# Altium schematic sheet MCU_Module.SchDoc
size A4; SheetNumber: 5; SheetTotal: 7
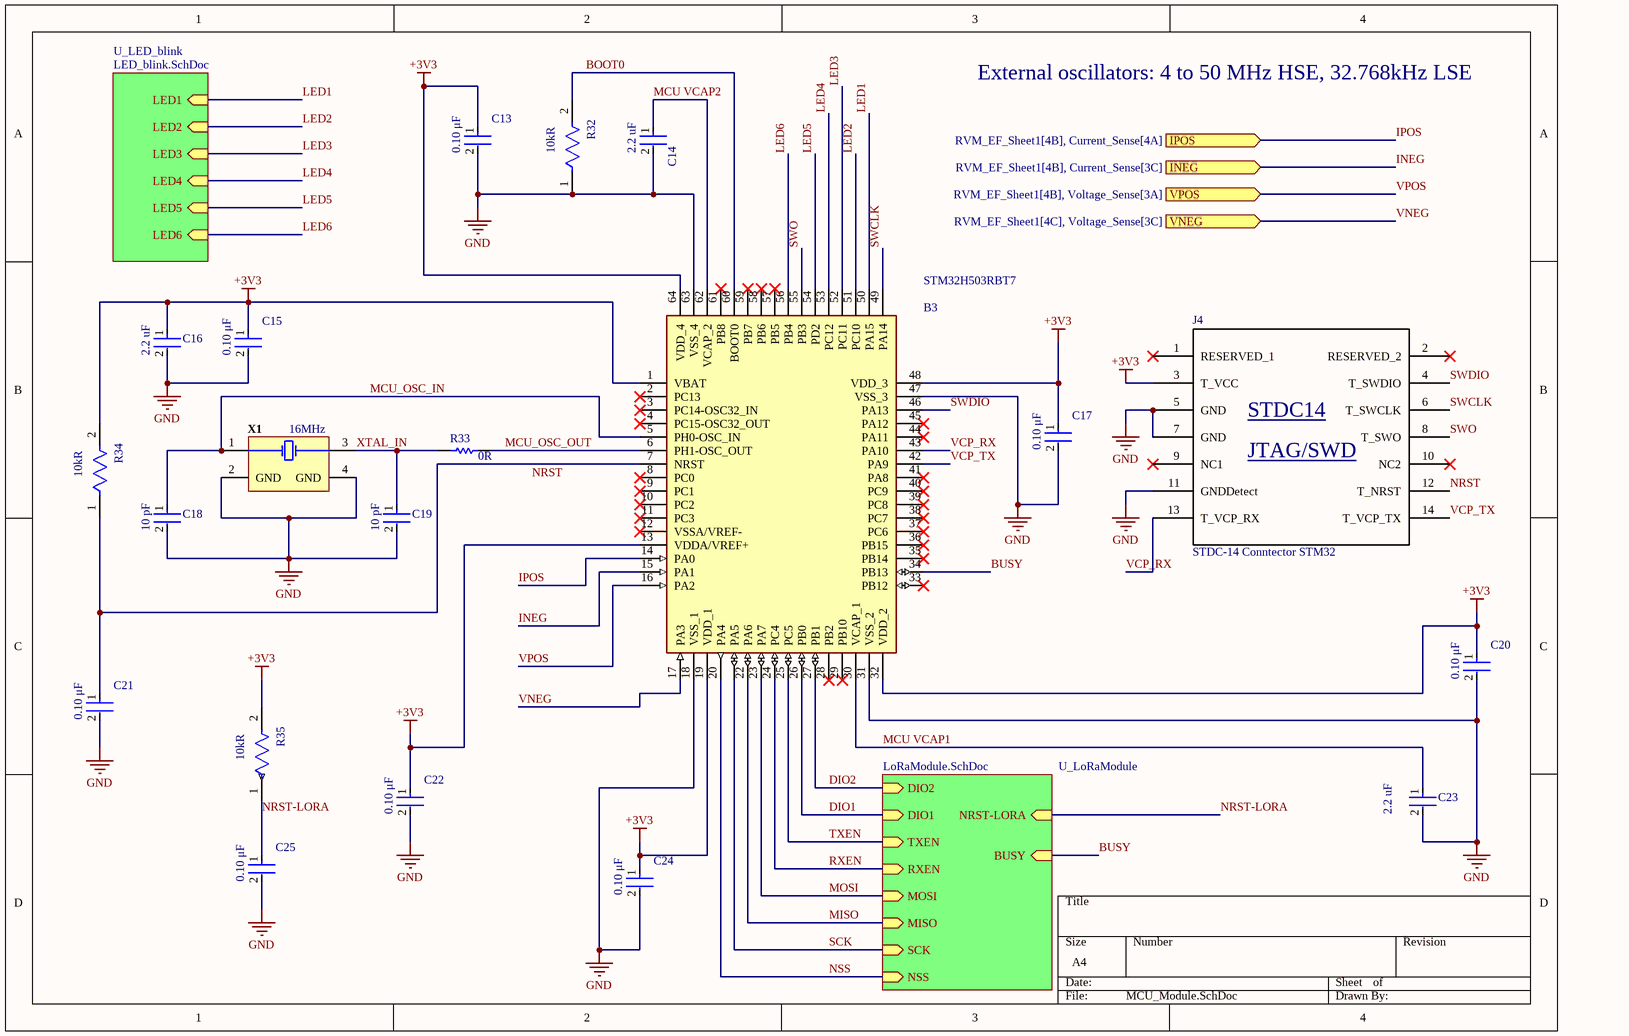
[diagram p0: MCU_Module.SchDoc]

## Parts
B3  STM32H503RBT7  [QFP50P1200X1200X160-64N]
C13  value 0.10 μF  [FP-C1206C-EB-MFG]  (hidden comment: C1206C104F3GACTU)
C14  value 2.2 uF  [FP-CC0805-0_85-MFG]  (hidden comment: CC0805KKX7R9BB225)
C15  value 0.10 μF  [FP-C1206C-EB-MFG]  (hidden comment: C1206C104F3GACTU)
C16  value 2.2 uF  [FP-CC0805-0_85-MFG]  (hidden comment: CC0805KKX7R9BB225)
C17  value 0.10 μF  [FP-C1206C-EB-MFG]  (hidden comment: C1206C104F3GACTU)
C18  value 10 pF  [FP-C0805C-DN-MFG]  (hidden comment: C0805C100JAGACTU)
C19  value 10 pF  [FP-C0805C-DN-MFG]  (hidden comment: C0805C100JAGACTU)
C20  value 0.10 μF  [FP-C1206C-EB-MFG]  (hidden comment: C1206C104F3GACTU)
C21  value 0.10 μF  [FP-C1206C-EB-MFG]  (hidden comment: C1206C104F3GACTU)
C22  value 0.10 μF  [FP-C1206C-EB-MFG]  (hidden comment: C1206C104F3GACTU)
C23  value 2.2 uF  [FP-CC0805-0_85-MFG]  (hidden comment: CC0805KKX7R9BB225)
C24  value 0.10 μF  [FP-C1206C-EB-MFG]  (hidden comment: C1206C104F3GACTU)
C25  value 0.10 μF  [FP-C1206C-EB-MFG]  (hidden comment: C1206C104F3GACTU)
J4  STDC-14 Conntector STM32  [DIP14]
R32  Resistance: 10kR  [FP-RMCF0805-IPC_A]  (hidden comment: RMCF0805FG10K0)
R33  value 0R  [RESC2013X60X35LL10T20]  (hidden comment: RC0805JR-130RL)
R34  Resistance: 10kR  [FP-RMCF0805-IPC_A]  (hidden comment: RMCF0805FG10K0)
R35  Resistance: 10kR  [FP-RMCF0805-IPC_A]  (hidden comment: RMCF0805FG10K0)
X1  Frequency: 16MHz  [EPSON-TSX-3225_V]  (hidden comment: TSX-3225 16.0000MF09Z-AC3)

## Sub-sheets
U_LED_blink = LED_blink.SchDoc: LED1 (in), LED2 (in), LED3 (in), LED4 (in), LED5 (in), LED6 (in)
U_LoRaModule = LoRaModule.SchDoc: BUSY (in), NRST-LORA (in), MISO (in), SCK (in), TXEN (in), RXEN (in), DIO2 (in), DIO1 (in), MOSI (in), NSS (in)

## Ports
INEG (in, see RVM_EF_Sheet1[4B], Current_Sense[3C]), IPOS (in, see RVM_EF_Sheet1[4B], Current_Sense[4A]), VNEG (in, see RVM_EF_Sheet1[4C], Voltage_Sense[3C]), VPOS (in, see RVM_EF_Sheet1[4B], Voltage_Sense[3A])

## Nets
+3V3: B3.1(VBAT) B3.13(VDDA/VREF+) B3.19(VDD_1) B3.32(VDD_2) B3.48(VDD_3) B3.64(VDD_4) C13.1 C15.1 C16.1 C17.1 C20.1 C22.1 C24.1 J4.3(T_VCC) R34.2 R35.2
GND: B3.18(VSS_1) B3.31(VSS_2) B3.47(VSS_3) B3.63(VSS_4) C13.2 C14.2 C15.2 C16.2 C17.2 C18.2 C19.2 C20.2 C21.2 C22.2 C23.2 C24.2 C25.2 J4.5(GND) J4.7(GND) J4.11(GNDDetect) R32.1 X1.2(GND) X1.4(GND)
BOOT0: B3.60(BOOT0) R32.2
BUSY: B3.34(PB13) ; sheet U_LoRaModule/BUSY
DIO1: B3.26(PB0) ; sheet U_LoRaModule/DIO1
DIO2: B3.27(PB1) ; sheet U_LoRaModule/DIO2
INEG: B3.15(PA1) ; port INEG
IPOS: B3.14(PA0) ; port IPOS
LED1: B3.50(PA15) ; sheet U_LED_blink/LED1
LED2: B3.51(PC10) ; sheet U_LED_blink/LED2
LED3: B3.52(PC11) ; sheet U_LED_blink/LED3
LED4: B3.53(PC12) ; sheet U_LED_blink/LED4
LED5: B3.54(PD2) ; sheet U_LED_blink/LED5
LED6: B3.56(PB4) ; sheet U_LED_blink/LED6
MCU VCAP1: B3.30(VCAP_1) C23.1
MCU VCAP2: B3.62(VCAP_2) C14.1
MCU_OSC_IN: B3.5(PH0-OSC_IN) C18.1 X1.1(X1)
MCU_OSC_OUT: B3.6(PH1-OSC_OUT) R33.1
MISO: B3.22(PA6) ; sheet U_LoRaModule/MISO
MOSI: B3.23(PA7) ; sheet U_LoRaModule/MOSI
NRST: B3.7(NRST) C21.1 J4.12(T_NRST) R34.1
NRST-LORA: C25.1 R35.1 ; sheet U_LoRaModule/NRST-LORA
NSS: B3.20(PA4) ; sheet U_LoRaModule/NSS
RXEN: B3.24(PC4) ; sheet U_LoRaModule/RXEN
SCK: B3.21(PA5) ; sheet U_LoRaModule/SCK
SWCLK: B3.49(PA14) J4.6(T_SWCLK)
SWDIO: B3.46(PA13) J4.4(T_SWDIO)
SWO: B3.55(PB3) J4.8(T_SWO)
TXEN: B3.25(PC5) ; sheet U_LoRaModule/TXEN
VCP_RX: B3.43(PA10) J4.13(T_VCP_RX)
VCP_TX: B3.42(PA9) J4.14(T_VCP_TX)
VNEG: B3.17(PA3) ; port VNEG
VPOS: B3.16(PA2) ; port VPOS
XTAL_IN: C19.1 R33.2 X1.3(X2)

Not connected (* = marked no-connect by the designer): B3 2(PC13)* 3(PC14-OSC32_IN)* 4(PC15-OSC32_OUT)* 8(PC0)* 9(PC1)* 10(PC2)* 11(PC3)* 12(VSSA/VREF-)* 28(PB2)* 29(PB10)* 33(PB12)* 35(PB14)* 36(PB15)* 37(PC6)* 38(PC7)* 39(PC8)* 40(PC9)* 41(PA8)* 44(PA11)* 45(PA12)* 57(PB5)* 58(PB6)* 59(PB7)* 61(PB8)*; J4 1(RESERVED_1)* 2(RESERVED_2)* 9(NC1)* 10(NC2)*

## Notes on the sheet
- External oscillators: 4 to 50 MHz HSE, 32.768kHz LSE
- (in symbol STDC14) JTAG/SWD

## Library data of the parts
B3 = STM32H503RBT7: Arm Cortex-M33 32-bit MCU+FPU, 375 DMIPS, 250 MHz, 128 Kbytes flash memory, 32 Kbytes RAM, I3C; Manufacturer_Name: STMicroelectronics; Geometry.Height: 1.6mm; Mouser Part Number: 511-STM32H503RBT7; Mouser Price/Stock: https://www.mouser.co.uk/ProductDetail/STMicroelectronics/STM32H503RBT7?qs=Z%252BL2brAPG1Lgew3845jGyA%3D%3D; Manufacturer_Part_Number: STM32H503RBT7; Datasheet Link: https://www.st.com/resource/en/datasheet/stm32h503eb.pdf
C13 C15 C17 C20-C22 C24 C25 = CMP-1037-04186-2: CAP CER 0.1UF 25V C0G/NP0 1206; Manufacturer: KEMET; Material: Ceramic; Temperature Characteristic: C0G; Temperature Coefficient: 15%; Tolerance: 0.01; Automotive Grade: Grade 0; Device Class L3: Ceramic Capacitors; Voltage Rating: 25 V; Temperature Range Low: -55°C; RoHS: TRUE; Package: C1206C-EB; Category: Cap; Lead Free: Yes; Manufacturer Part Number: C1206C104F3GACTU; ComponentLink2URL: https://content.kemet.com/datasheets/KEM_C1007_X8R_ULTRA_150C_SMD.pdf; Ipc Land Pattern Name: CAPC320160X78; Temperature Range High: +150°C; Height: 0.88mm; Digikey Description: CAP CER 0.1UF 25V C0G/NP0 1206; ComponentLink2Description: Datasheet; Capacitance: 0.10 μF; Mouser Description: Multilayer Ceramic Capacitors MLCC - SMD/SMT 25volts 0.1uF 1% C0G; Octopart: https://octopart.com/c1206c104f3gactu-kemet-13149870; Device Class L1: Passive Components; Device Class L2: Capacitors; Automotive: Yes; Temperature: -55°C to +150°C
C14 C16 C23 = CMP-03422-001390-1: CAP CER 2.2UF 50V X7R 0805; Manufacturer: Yageo; Tolerance: 0.1; Material: Ceramic; ComponentLink2Description: Datasheet; ComponentLink2URL: http://www.yageo.com/documents/recent/UPY-GPHC_Y5V_6.3V-to-50V_8.pdf; Voltage Rating: 50 V; Device Class L2: Capacitors; Footprint Url: http://www.yageo.com/exep/pages/download/literatures/UPY-C_GEN_24.pdf; Device Class L3: Ceramic Capacitors; Temperature Range High: +85°C; Category: Cap; Lead Free: Yes; Height: 0.95mm; Automotive: No; Temperature Range Low: -30°C; Octopart: https://octopart.com/cc0805kkx7r9bb225-yageo-51849248; Temperature Characteristic: X7R; Ipc Land Pattern Name: CAPC200125X85; Mouser Description: 0805 50 V 2.2 uF ±10% Tolerance X7R Multilayer Ceramic Capacitor; RoHS: TRUE; Temperature: -30°C to +85°C; Capacitance: 2.2 uF; Package: CC0805-0.85; Digikey Description: CAP CER 2.2UF 50V X7R 0805; Manufacturer Part Number: CC0805KKX7R9BB225; Device Class L1: Passive Components
C18 C19 = CMP-03020-028919-1: C0805 10 pF C0G 30ppm/°C 5.00% 250 V; Manufacturer: KEMET; Tolerance: 0.05; Voltage Rating: 250 V; Material: Ceramic; Temperature Range High: +125°C; Temperature: -55°C to +125°C; Temperature Characteristic: C0G; Height: 0.88mm; Package: C0805C-DN; Automotive: No; Capacitance: 10 pF; Device Class L1: Passive Components; RoHS: TRUE; Manufacturer Part Number: C0805C100JAGACTU; Ipc Land Pattern Name: CAPC200125X78; Device Class L2: Capacitors; ComponentLink2Description: Datasheet; Temperature Range Low: -55°C; ComponentLink2URL: https://content.kemet.com/datasheets/KEM_C1003_C0G_SMD.pdf; Lead Free: Yes; Temperature Coefficient: 30ppm/°C; Octopart: https://octopart.com/c0805c100jagactu-kemet-88373098; Category: Cap; Device Class L3: Ceramic Capacitors
J4 = STDC14
R32 R34 R35 = CMP-26527-002739-1: 10kΩ ±1% 0.125W 0805 Thick Film Chip Resistor AEC-Q200 compliant; Max Power Dissipation: 125mW; Temperature Coefficient: 100ppm/°C; Construction: Rectangular; Case/Package: 0805; Contact Plating: Tin; RoHS Compliant: Yes; Mount: Surface Mount; Case Code (Metric): 2012; Radiation Hardening: No; Packaging: Tape and Reel; Case Code (Imperial): 0805; Tolerance: 1%; Max Operating Temperature: 155°C; Length: 0.079inch; Min Operating Temperature: -55°C; Features: Automotive AEC-Q200; Width: 0.049inch; Height: 0.026inch; Depth: 1.25mm; Number of Terminations: 2; Resistor Type: Thick Film; Series: RMCF; Military Standard: Not
R33 = CMP-2001-01414-1: Manufacturer: Yageo; Part Number: RC0805JR-130RL
X1 = CMP-2000-07331-1: Crystal, 16 MHz, -40 to 85 degC, 4-Pin SMD, RoHS, Tape and Reel; Manufacturer: Epson; ESR: 60Ohms; Brand: EpsonTiming; Load Capacitance: 9pF; Frequency Stability: 10PPM; Unit Weight: 0.000564oz; Drive Level: 200uW; Factory Pack Quantity: 250; Mounting Style: SMD/SMT; Packaging: Reel; Datasheet URL: https://support.epson.biz/td/api/doc_check.php?dl=brief_FA-238V_en.pdf; Datasheet Version: 12/2015; Package Reference: TSX-3225; Series: TSX-3225; Package / Case: 3.2mmx2.5mm; Package Description: 4-Pin Surface Mount Device, Body 3.2 x 2.5 mm; Type: Crystal; Height: 0.6mm; Manufacturer URL: https://www.eea.epson.com/; Operating Temperature Range: -20Cto+75C; Length: 3.2mm; Width: 2.5mm; RoHS: True; Mounting Technology: SurfaceMount; Termination Style: SMD/SMT; Product Category: Crystals; Tolerance: 10PPM